# Altium schematic sheet Plytka_gorna_lora_czujniki.SchDoc
size A4; SheetNumber: 1; SheetTotal: 1
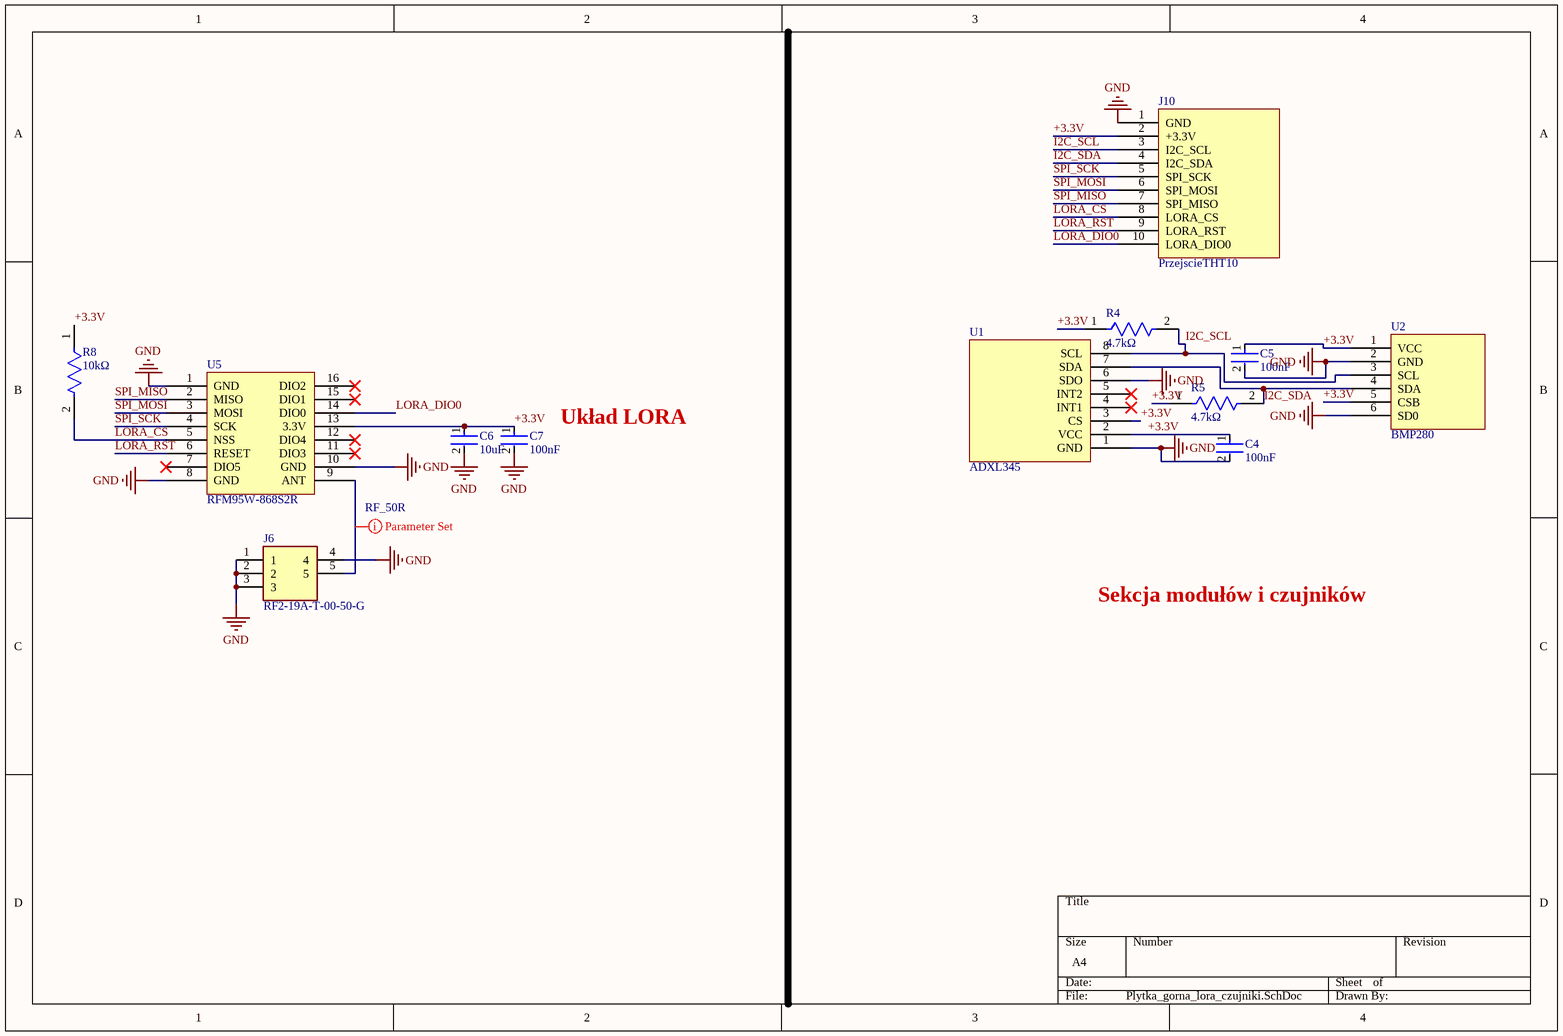
[diagram p0: Plytka_gorna_lora_czujniki.SchDoc]

## Parts
C4  100nF  [FP-C0805C-DN-MFG]
C5  100nF  [FP-C0805C-DN-MFG]
C6  10uF  [FP-C0805C-DN-MFG]
C7  100nF  [FP-C0805C-DN-MFG]
J6  RF2-19A-T-00-50-G  [RF219AT0050G]
J10  PrzejscieTHT10  [PrzejscieTHT10]
R4  4.7kΩ  [FP-CRGCQ0805-IPC_C]
R5  4.7kΩ  [FP-CRGCQ0805-IPC_C]
R8  10kΩ  [FP-CRGCQ0805-IPC_C]
U1  ADXL345  [ADXL345]
U2  BMP280  [BMP280]
U5  RFM95W-868S2R  [RFM95W-868S2R]

## Nets
GND: C4.2 C5.2 C6.2 C7.2 J6.1 J6.2 J6.3 J6.4 J10.1(GND) U1.1(GND) U1.6(SDO) U2.2(GND) U2.6(SD0) U5.1(GND) U5.8(GND) U5.10(GND)
+3.3V: C4.1 C5.1 C6.1 C7.1 J10.2(+3.3V) R4.1 R5.1 R8.1 U1.2(VCC) U1.3(CS) U2.1(VCC) U2.5(CSB) U5.13(3.3V)
I2C_SCL: J10.3(I2C_SCL) R4.2 U1.8(SCL) U2.3(SCL)
I2C_SDA: J10.4(I2C_SDA) R5.2 U1.7(SDA) U2.4(SDA)
LORA_CS: J10.8(LORA_CS) R8.2 U5.5(NSS)
LORA_DIO0: J10.10(LORA_DIO0) U5.14(DIO0)
LORA_RST: J10.9(LORA_RST) U5.6(RESET)
SPI_MISO: J10.7(SPI_MISO) U5.2(MISO)
SPI_MOSI: J10.6(SPI_MOSI) U5.3(MOSI)
SPI_SCK: J10.5(SPI_SCK) U5.4(SCK)
NetJ6_5: J6.5 U5.9(ANT)

Not connected (* = marked no-connect by the designer): U1 4(INT1)* 5(INT2)*; U5 7(DIO5)* 11(DIO3)* 12(DIO4)* 15(DIO1)* 16(DIO2)*

## Layout directives
net class RF_50R: NetJ6_5

## Notes on the sheet
- (near C7) Układ LORA
- Sekcja modułów i czujników

## Library data of the parts
C4 C5 C7 = CMP-2007-00274-2: CAP CER 0.1UF 16V X7R 0805; Manufacturer Part Number: C0805C104K4RACTU; Manufacturer: KEMET; Material: Ceramic; Tolerance: 0.1; Capacitance: 0.10 μF; Value: 0.10 μF; Temperature Coefficient: 30ppm/°C; Device Class L3: Ceramic Capacitors; RoHS: TRUE; Octopart: https://octopart.com/c0805c104k4ractu-kemet-92155; ComponentLink2Description: Datasheet; ComponentLink2URL: https://content.kemet.com/datasheets/KEM_C1003_C0G_SMD.pdf; Temperature Range High: +125°C; Category: Cap; Lead Free: Yes; Digikey Description: CAP CER 0.1UF 16V X7R 0805; Automotive: No; Temperature Range Low: -55°C; Voltage Rating: 16 V; Package: C0805C-DN; Ipc Land Pattern Name: CAPC200125X78; Height: 0.88mm; Device Class L1: Passive Components; Temperature: -55°C to +125°C; Mouser Description: Multilayer Ceramic Capacitors MLCC - SMD/SMT 16volts 0.1uF X7R 10%; Device Class L2: Capacitors; Temperature Characteristic: X7R
C6 = CMP-2007-00274-2: CAP CER 10UF 16V X7R 0805; Manufacturer Part Number: C0805C104K4RACTU; Manufacturer: KEMET; Material: Ceramic; Tolerance: 0.1; Capacitance: 10μF; Value: 10μF; Temperature Coefficient: 30ppm/°C; Device Class L3: Ceramic Capacitors; RoHS: TRUE; Octopart: https://octopart.com/c0805c104k4ractu-kemet-92155; ComponentLink2Description: Datasheet; ComponentLink2URL: https://content.kemet.com/datasheets/KEM_C1003_C0G_SMD.pdf; Temperature Range High: +125°C; Category: Cap; Lead Free: Yes; Digikey Description: CAP CER 0.1UF 16V X7R 0805; Automotive: No; Temperature Range Low: -55°C; Voltage Rating: 16 V; Package: C0805C-DN; Ipc Land Pattern Name: CAPC200125X78; Height: 0.88mm; Device Class L1: Passive Components; Temperature: -55°C to +125°C; Mouser Description: Multilayer Ceramic Capacitors MLCC - SMD/SMT 16volts 0.1uF X7R 10%; Device Class L2: Capacitors; Temperature Characteristic: X7R
J6 = RF2-19A-T-00-50-G: Conn SMA 0Hz to 18GHz 50Ohm Solder ST Thru-Hole RCP Gold; Manufacturer_Name: Adam Tech; Geometry.Height: 9.6mm; Manufacturer_Part_Number: RF2-19A-T-00-50-G; Mouser Part Number: 737-RF219AT0050G; Mouser Price/Stock: https://www.mouser.co.uk/ProductDetail/Adam-Tech/RF2-19A-T-00-50-G?qs=HoCaDK9Nz5fMXe4fVjtozw%3D%3D; Arrow Part Number: RF2-19A-T-00-50-G; Arrow Price/Stock: https://www.arrow.com/en/products/rf2-19a-t-00-50-g/adam-tech?region=nac; Datasheet Link: chrome-extension://efaidnbmnnnibpcajpcglclefindmkaj/https://www.mouser.it/datasheet/2/4/rf2_19a_t_00_50_g_data_sheet-3397228.pdf
R4 R5 = CMP-03211-002989-1: CRGCQ 0805 4.7K 5%; Manufacturer Part Number: CRGCQ0805J10K; Manufacturer: TE Connectivity; Voltage Rating: 150V; Temperature Coefficient: ±100ppm/°C; Power Rating: 0.125W; Tolerance: 0.05; Automotive Grade: Grade 914; Height: 0.65mm; Lead Free: Yes; Temperature Range High: +155°C; Composition: Thick Film; Temperature Range Low: -55°C; Resistance: 4.7KΩ; Ambient Temperature Range High: +70°C; Temperature: -55°C to +155°C; Package: CRGCQ0805; Device Class L2: Resistors; RoHS: TRUE; ComponentLink2URL: https://www.te.com/commerce/DocumentDelivery/DDEController?Action=showdoc&DocId=Data+Sheet%7F1773204-3%7F1%7Fpdf%7FEnglish%7FENG_DS_1773204-3_1.pdf%7F4-2176341-923; Series: CRGCQ; Device Class L1: Passive Components; Ipc Land Pattern Name: RESC200125X55; Value: 4.7KΩ; ComponentLink2Description: Datasheet; Category: Res; Digikey Description: CRGCQ 0805 10K 5%; Mouser Description: Res Thick Film 0805 10K Ohm 5% 0.125W(1/8W) ±100ppm/C Pad SMD Automotive T/R; Automotive: Yes; Octopart: https://octopart.com/crgcq0805j10k-te+connectivity-91018201; Device Class L3: Chip SMD Resistors
R8 = CMP-03211-002989-1: CRGCQ 0805 10K 5%; Manufacturer Part Number: CRGCQ0805J10K; Manufacturer: TE Connectivity; Voltage Rating: 150V; Temperature Coefficient: ±100ppm/°C; Power Rating: 0.125W; Tolerance: 0.05; Automotive Grade: Grade 914; Height: 0.65mm; Lead Free: Yes; Temperature Range High: +155°C; Composition: Thick Film; Temperature Range Low: -55°C; Resistance: 10KΩ; Ambient Temperature Range High: +70°C; Temperature: -55°C to +155°C; Package: CRGCQ0805; Device Class L2: Resistors; RoHS: TRUE; ComponentLink2URL: https://www.te.com/commerce/DocumentDelivery/DDEController?Action=showdoc&DocId=Data+Sheet%7F1773204-3%7F1%7Fpdf%7FEnglish%7FENG_DS_1773204-3_1.pdf%7F4-2176341-923; Series: CRGCQ; Device Class L1: Passive Components; Ipc Land Pattern Name: RESC200125X55; Value: 10KΩ; ComponentLink2Description: Datasheet; Category: Res; Digikey Description: CRGCQ 0805 10K 5%; Mouser Description: Res Thick Film 0805 10K Ohm 5% 0.125W(1/8W) ±100ppm/C Pad SMD Automotive T/R; Automotive: Yes; Octopart: https://octopart.com/crgcq0805j10k-te+connectivity-91018201; Device Class L3: Chip SMD Resistors